# Altium project Cyborg_greenC_LED_UV.PrjPcb
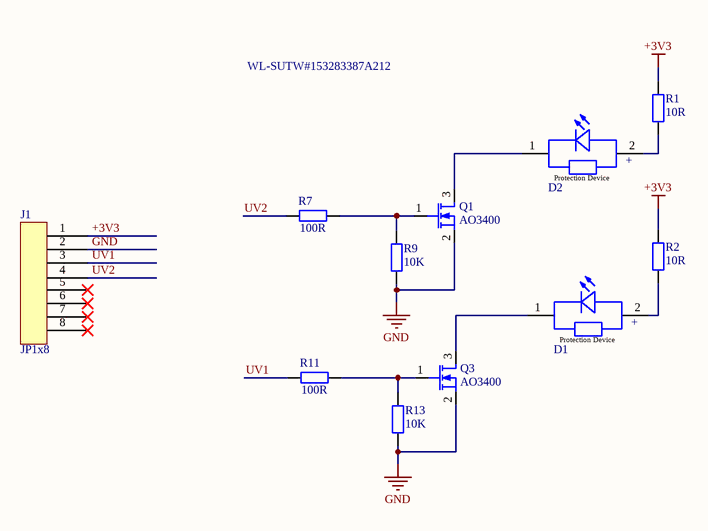
[diagram p0: SCH_Cyborg_greenC_LED_UV.SchDoc]
1 sheet, 11 parts. Net scope: global (net labels, ports and power ports of the same name join across sheets).
Board file: PCB_Cyborg_greenC_LED_UV.PcbDoc

## Sheet SCH_Cyborg_greenC_LED_UV.SchDoc
size A4; SheetNumber: 1; SheetTotal: 1

### Parts
D1  Ultraviolet, 3.6V, 120°  [WL-SUTW_2835]  (value not drawn)
D2  Ultraviolet, 3.6V, 120°  [WL-SUTW_2835]  (value not drawn)
J1  JP1x8  [JP1X8 1.27mm]
Q1  AO3400  [SOT23-132]
Q3  AO3400  [SOT23-132]
R1  10R  [tro smd 0603]
R2  10R  [tro smd 0603]
R7  100R  [tro smd 0603]
R9  10K  [tro smd 0603]
R11  100R  [tro smd 0603]
R13  10K  [tro smd 0603]

### Nets
+3V3: J1.1 R1.1 R2.1
GND: J1.2 Q1.2(S) Q3.2(S) R9.2 R13.2
UV1: J1.3 R11.1
UV2: J1.4 R7.1
NetD1_1: D1.1(K) Q3.3(D)
NetD1_2: D1.2(A) R2.2
NetD2_1: D2.1(K) Q1.3(D)
NetD2_2: D2.2(A) R1.2
NetQ1_1: Q1.1(G) R7.2 R9.1
NetQ3_1: Q3.1(G) R11.2 R13.1

Not connected (* = marked no-connect by the designer): J1 5* 6* 7* 8*

### Notes on the sheet
- WL-SUTW#153283387A212
- Title
- Size:
- Date:
- A4
- Number:
- Time:
- Revision:
- Sheet
- of
- File:
- (in symbol 153283367A212) +; Protection Device

### Library data of the parts
D1 D2 = 153283367A212: WL-SUTW SMT Ultraviolet Top LED Waterclear, size 2835, Ultraviolet, 3.6V, 120°; Manufacturer: Wurth Elektronik; Case/Size Code: 2835; Chip Technology: AlInGaN; Peak Wavelength: 365nm; Radiant Flux Min: 30mW; Radiant Flux: 50mW; Manufacturer Part Number: 153283367A212; Category: Ultraviolet; Match Code: WL-SUTW; ComponentLink1Description: Website Link; ComponentLink1URL: https://www.we-online.com/redexpert/article/153283367A212?ad; ComponentLink2Description: Datasheet Link; ComponentLink2URL: https://www.we-online.com/redexpert/spec/153283367A212?ad; Mount: Surface Mount; Operating Temperature Max: 85°C; Operating Temperature Min: -40°C; Packaging: Tape and Reel; Length: 3.5mm; Width: 2.8mm; Height: 0.7mm; Emitting Color: Ultraviolet; Forward Voltage: 3.6V; Viewing Angle: 120°
J1 = JP1x8: 1.27mm
Q1 Q3 = Si2302DS: N-Channel MOSFET; Published: 8-Jun-2000; LatestRevisionDate: 17-Jul-2002; LatestRevisionNote: Re-released for DXP Platform.; PackageVersion: 1995/1996; PackageReference: E3; Publisher: Altium Limited; PackageDescription: TO, Flat Index; 3 In-Line, Axial Leads; Body Dia. 4.6mm; Lead Dia. 0.5 mm (max)
R1 R2 R7 R9 R11 R13 = Tro 0603 5% 1k: Dán; Don_Vi: Con; So_Chan: 2; Ten_Linh_Kien: Trở 0603 5% 1k; Ma_Hang: MH006319; Chung_Loai: Dán; Kieu_Chan: *